# Altium schematic sheet LEDDisplays.SchDoc
size A3; SheetNumber: 3; SheetTotal: 5
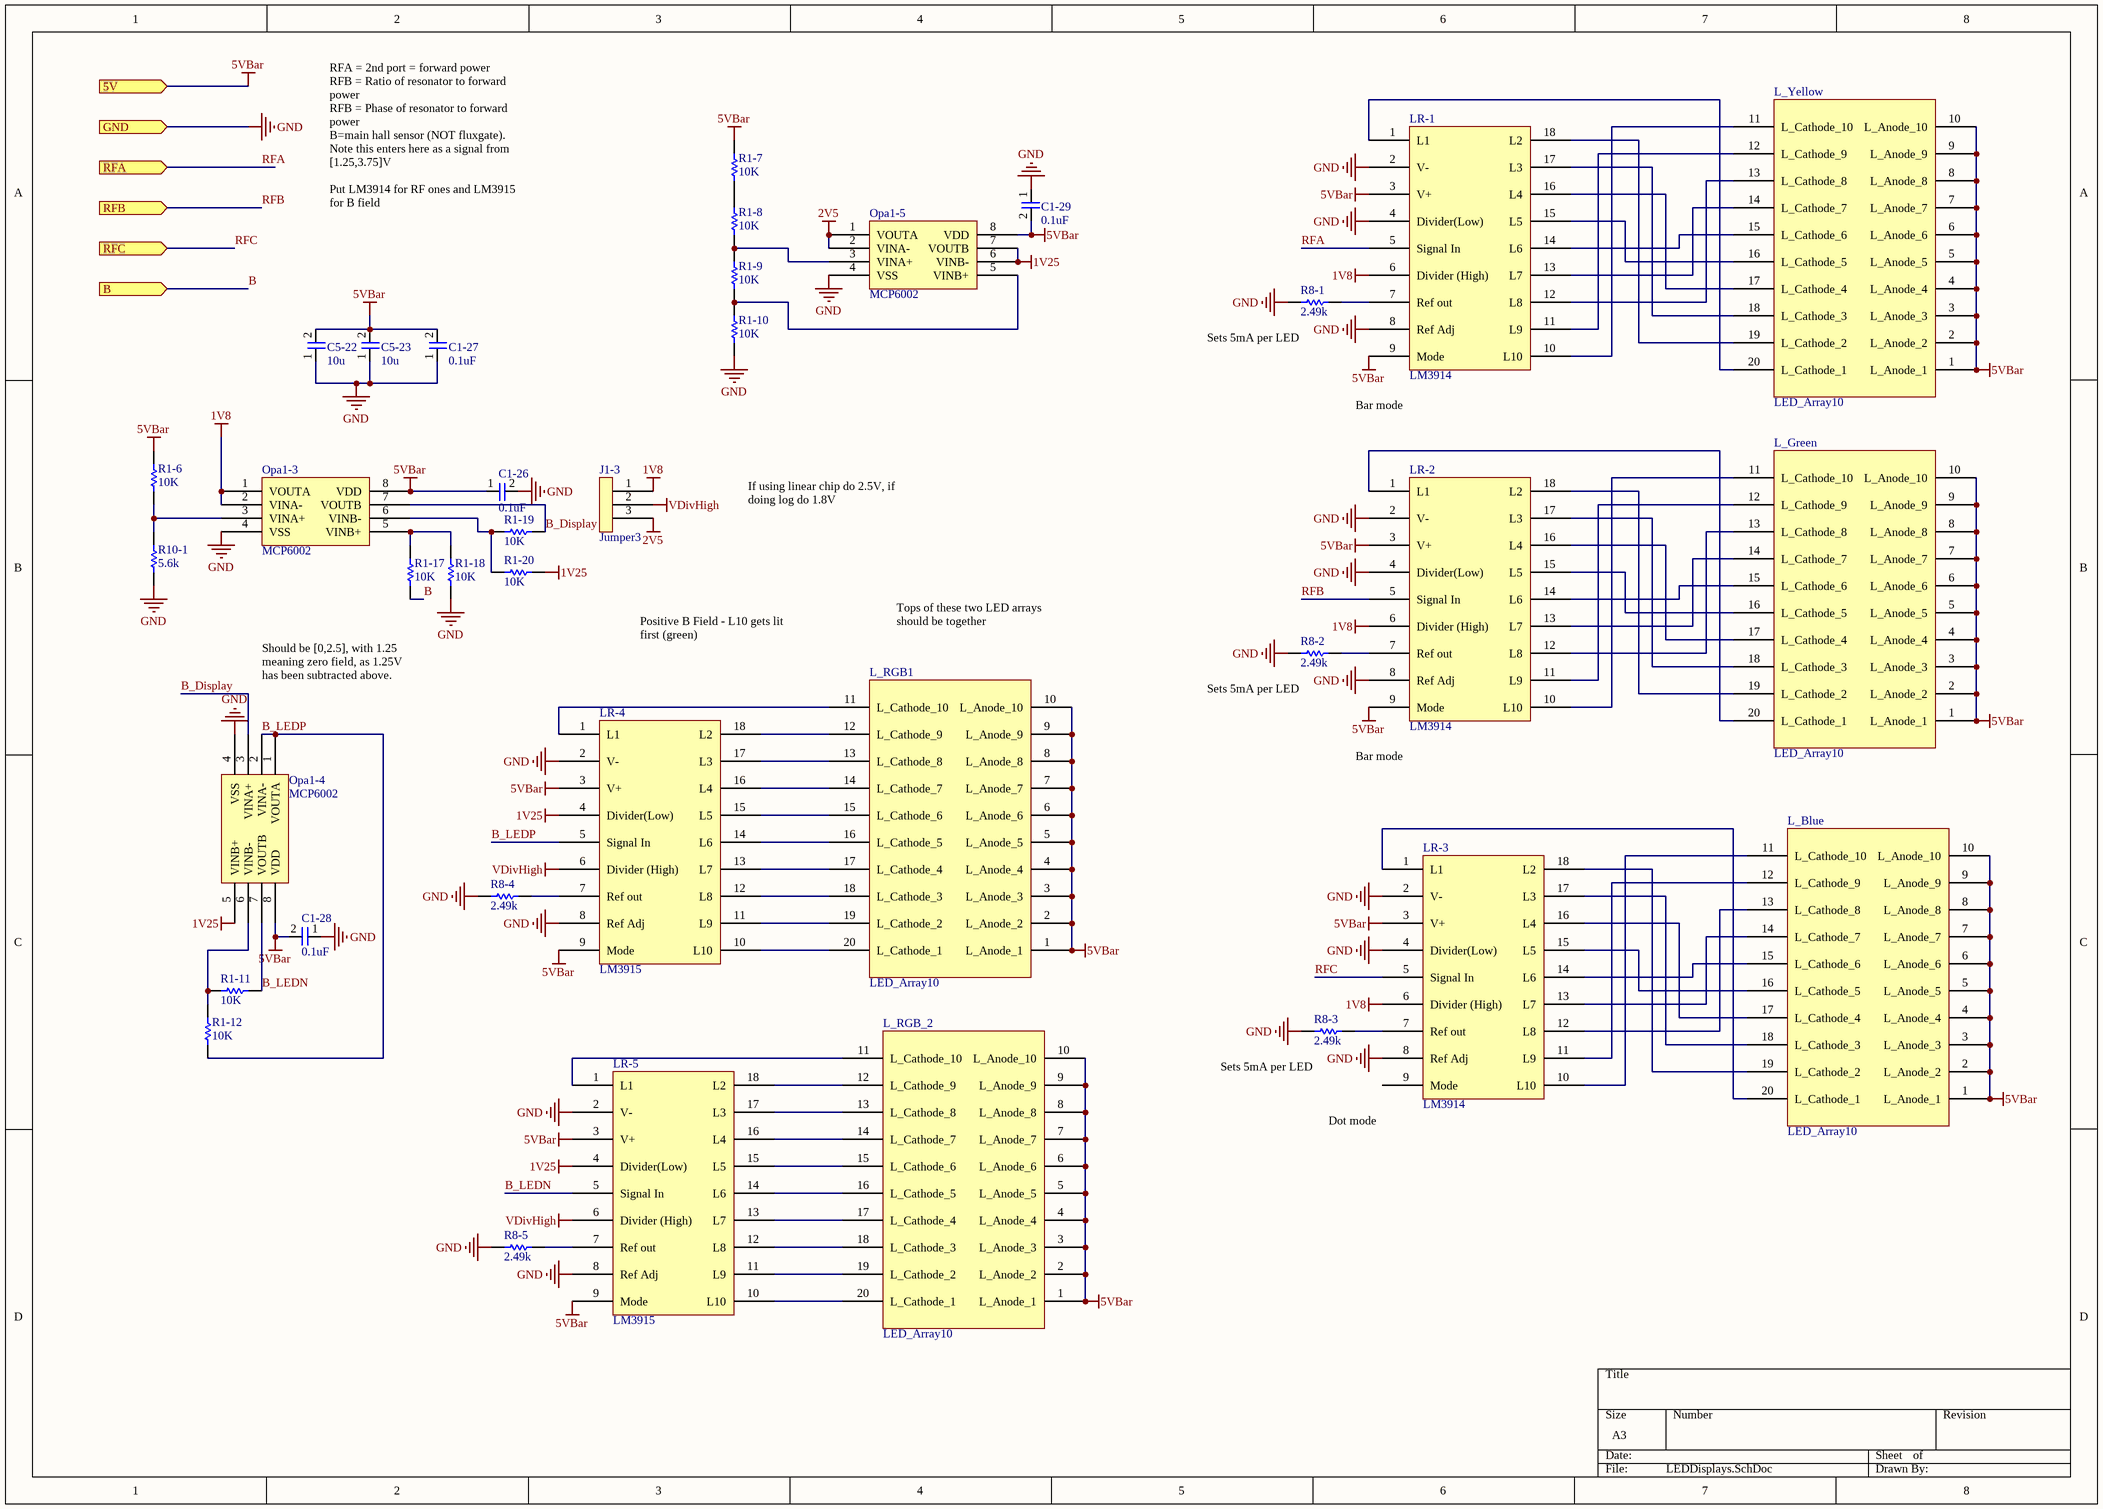
[diagram p0: LEDDisplays.SchDoc]

## Parts
C1-26  0.1uF  [0805]
C1-27  0.1uF  [0805]
C1-28  0.1uF  [0805]
C1-29  0.1uF  [0805]
C5-22  10u  [1206]
C5-23  10u  [1206]
J1-3  Jumper3  [Jumper]
L_Blue  LED_Array10  [10-DIP]
L_Green  LED_Array10  [10-DIP]
L_RGB1  LED_Array10  [10-DIP]
L_RGB_2  LED_Array10  [10-DIP]
L_Yellow  LED_Array10  [10-DIP]
LR-1  LM3914  [18-DIP-Sockeyt]
LR-2  LM3914  [18-DIP-Sockeyt]
LR-3  LM3914  [18-DIP-Sockeyt]
LR-4  LM3915  [18-DIP-Sockeyt]
LR-5  LM3915  [18-DIP-Sockeyt]
Opa1-3  MCP6002  [8-MSOP]
Opa1-4  MCP6002  [8-MSOP]
Opa1-5  MCP6002  [8-MSOP]
R1-6  10K  [0603]
R1-7  10K  [0603]
R1-8  10K  [0603]
R1-9  10K  [0603]
R1-10  10K  [0603]
R1-11  10K  [0603]
R1-12  10K  [0603]
R1-17  10K  [0603]
R1-18  10K  [0603]
R1-19  10K  [0603]
R1-20  10K  [0603]
R8-1  2.49k  [0603]
R8-2  2.49k  [0603]
R8-3  2.49k  [0603]
R8-4  2.49k  [0603]
R8-5  2.49k  [0603]
R10-1  5.6k  [0603]

## Ports
5V (in), B (in), GND (in), RFA (in), RFB (in), RFC (in)

## Nets
1V8: J1-3.1 LR-1.6(Divider_(High)) LR-2.6(Divider_(High)) LR-3.6(Divider_(High)) Opa1-3.1(VOUTA) Opa1-3.2(VINA-)
1V25: LR-4.4(Divider(Low)) LR-5.4(Divider(Low)) Opa1-4.5(VINB+) Opa1-5.6(VINB-) Opa1-5.7(VOUTB) R1-20.2
2V5: J1-3.3 Opa1-5.1(VOUTA) Opa1-5.2(VINA-)
5VBar: C1-26.1 C1-27.2 C1-28.2 C1-29.2 C5-22.2(C1-1) C5-23.2(C1-1) L_Blue.1(L_Anode_1) L_Blue.2(L_Anode_2) L_Blue.3(L_Anode_3) L_Blue.4(L_Anode_4) L_Blue.5(L_Anode_5) L_Blue.6(L_Anode_6) L_Blue.7(L_Anode_7) L_Blue.8(L_Anode_8) L_Blue.9(L_Anode_9) L_Blue.10(L_Anode_10) L_Green.1(L_Anode_1) L_Green.2(L_Anode_2) L_Green.3(L_Anode_3) L_Green.4(L_Anode_4) L_Green.5(L_Anode_5) L_Green.6(L_Anode_6) L_Green.7(L_Anode_7) L_Green.8(L_Anode_8) L_Green.9(L_Anode_9) L_Green.10(L_Anode_10) L_RGB1.1(L_Anode_1) L_RGB1.2(L_Anode_2) L_RGB1.3(L_Anode_3) L_RGB1.4(L_Anode_4) L_RGB1.5(L_Anode_5) L_RGB1.6(L_Anode_6) L_RGB1.7(L_Anode_7) L_RGB1.8(L_Anode_8) L_RGB1.9(L_Anode_9) L_RGB1.10(L_Anode_10) L_RGB_2.1(L_Anode_1) L_RGB_2.2(L_Anode_2) L_RGB_2.3(L_Anode_3) L_RGB_2.4(L_Anode_4) L_RGB_2.5(L_Anode_5) L_RGB_2.6(L_Anode_6) L_RGB_2.7(L_Anode_7) L_RGB_2.8(L_Anode_8) L_RGB_2.9(L_Anode_9) L_RGB_2.10(L_Anode_10) L_Yellow.1(L_Anode_1) L_Yellow.2(L_Anode_2) L_Yellow.3(L_Anode_3) L_Yellow.4(L_Anode_4) L_Yellow.5(L_Anode_5) L_Yellow.6(L_Anode_6) L_Yellow.7(L_Anode_7) L_Yellow.8(L_Anode_8) L_Yellow.9(L_Anode_9) L_Yellow.10(L_Anode_10) LR-1.3(V+) LR-1.9(Mode) LR-2.3(V+) LR-2.9(Mode) LR-3.3(V+) LR-4.3(V+) LR-4.9(Mode) LR-5.3(V+) LR-5.9(Mode) Opa1-3.8(VDD) Opa1-4.8(VDD) Opa1-5.8(VDD) R1-6.1 R1-7.1 ; port 5V
GND: C1-26.2 C1-27.1 C1-28.1 C1-29.1 C5-22.1 C5-23.1 LR-1.2(V-) LR-1.4(Divider(Low)) LR-1.8(Ref_Adj) LR-2.2(V-) LR-2.4(Divider(Low)) LR-2.8(Ref_Adj) LR-3.2(V-) LR-3.4(Divider(Low)) LR-3.8(Ref_Adj) LR-4.2(V-) LR-4.8(Ref_Adj) LR-5.2(V-) LR-5.8(Ref_Adj) Opa1-3.4(VSS) Opa1-4.4(VSS) Opa1-5.4(VSS) R1-10.2 R1-18.2 R8-1.1 R8-2.1 R8-3.1 R8-4.1 R8-5.1 R10-1.2 ; port GND
VDivHigh: J1-3.2 LR-4.6(Divider_(High)) LR-5.6(Divider_(High))
B: R1-17.1 ; port B
B_Display: Opa1-3.7(VOUTB) Opa1-4.3(VINA+) R1-19.2
B_LEDN: LR-5.5(Signal_In) Opa1-4.7(VOUTB) R1-11.2
B_LEDP: LR-4.5(Signal_In) Opa1-4.1(VOUTA) Opa1-4.2(VINA-) R1-12.2
RFA: LR-1.5(Signal_In) ; port RFA
RFB: LR-2.5(Signal_In) ; port RFB
RFC: LR-3.5(Signal_In) ; port RFC
NetL_Blue_11: L_Blue.11(L_Cathode_10) LR-3.10(L10)
NetL_Blue_12: L_Blue.12(L_Cathode_9) LR-3.11(L9)
NetL_Blue_13: L_Blue.13(L_Cathode_8) LR-3.12(L8)
NetL_Blue_14: L_Blue.14(L_Cathode_7) LR-3.13(L7)
NetL_Blue_15: L_Blue.15(L_Cathode_6) LR-3.14(L6)
NetL_Blue_16: L_Blue.16(L_Cathode_5) LR-3.15(L5)
NetL_Blue_17: L_Blue.17(L_Cathode_4) LR-3.16(L4)
NetL_Blue_18: L_Blue.18(L_Cathode_3) LR-3.17(L3)
NetL_Blue_19: L_Blue.19(L_Cathode_2) LR-3.18(L2)
NetL_Blue_20: L_Blue.20(L_Cathode_1) LR-3.1(L1)
NetL_Green_11: L_Green.11(L_Cathode_10) LR-2.10(L10)
NetL_Green_12: L_Green.12(L_Cathode_9) LR-2.11(L9)
NetL_Green_13: L_Green.13(L_Cathode_8) LR-2.12(L8)
NetL_Green_14: L_Green.14(L_Cathode_7) LR-2.13(L7)
NetL_Green_15: L_Green.15(L_Cathode_6) LR-2.14(L6)
NetL_Green_16: L_Green.16(L_Cathode_5) LR-2.15(L5)
NetL_Green_17: L_Green.17(L_Cathode_4) LR-2.16(L4)
NetL_Green_18: L_Green.18(L_Cathode_3) LR-2.17(L3)
NetL_Green_19: L_Green.19(L_Cathode_2) LR-2.18(L2)
NetL_Green_20: L_Green.20(L_Cathode_1) LR-2.1(L1)
NetL_RGB1_11: L_RGB1.11(L_Cathode_10) LR-4.1(L1)
NetL_RGB1_12: L_RGB1.12(L_Cathode_9) LR-4.18(L2)
NetL_RGB1_13: L_RGB1.13(L_Cathode_8) LR-4.17(L3)
NetL_RGB1_14: L_RGB1.14(L_Cathode_7) LR-4.16(L4)
NetL_RGB1_15: L_RGB1.15(L_Cathode_6) LR-4.15(L5)
NetL_RGB1_16: L_RGB1.16(L_Cathode_5) LR-4.14(L6)
NetL_RGB1_17: L_RGB1.17(L_Cathode_4) LR-4.13(L7)
NetL_RGB1_18: L_RGB1.18(L_Cathode_3) LR-4.12(L8)
NetL_RGB1_19: L_RGB1.19(L_Cathode_2) LR-4.11(L9)
NetL_RGB1_20: L_RGB1.20(L_Cathode_1) LR-4.10(L10)
NetL_RGB_2_11: L_RGB_2.11(L_Cathode_10) LR-5.1(L1)
NetL_RGB_2_12: L_RGB_2.12(L_Cathode_9) LR-5.18(L2)
NetL_RGB_2_13: L_RGB_2.13(L_Cathode_8) LR-5.17(L3)
NetL_RGB_2_14: L_RGB_2.14(L_Cathode_7) LR-5.16(L4)
NetL_RGB_2_15: L_RGB_2.15(L_Cathode_6) LR-5.15(L5)
NetL_RGB_2_16: L_RGB_2.16(L_Cathode_5) LR-5.14(L6)
NetL_RGB_2_17: L_RGB_2.17(L_Cathode_4) LR-5.13(L7)
NetL_RGB_2_18: L_RGB_2.18(L_Cathode_3) LR-5.12(L8)
NetL_RGB_2_19: L_RGB_2.19(L_Cathode_2) LR-5.11(L9)
NetL_RGB_2_20: L_RGB_2.20(L_Cathode_1) LR-5.10(L10)
NetL_Yellow_11: L_Yellow.11(L_Cathode_10) LR-1.10(L10)
NetL_Yellow_12: L_Yellow.12(L_Cathode_9) LR-1.11(L9)
NetL_Yellow_13: L_Yellow.13(L_Cathode_8) LR-1.12(L8)
NetL_Yellow_14: L_Yellow.14(L_Cathode_7) LR-1.13(L7)
NetL_Yellow_15: L_Yellow.15(L_Cathode_6) LR-1.14(L6)
NetL_Yellow_16: L_Yellow.16(L_Cathode_5) LR-1.15(L5)
NetL_Yellow_17: L_Yellow.17(L_Cathode_4) LR-1.16(L4)
NetL_Yellow_18: L_Yellow.18(L_Cathode_3) LR-1.17(L3)
NetL_Yellow_19: L_Yellow.19(L_Cathode_2) LR-1.18(L2)
NetL_Yellow_20: L_Yellow.20(L_Cathode_1) LR-1.1(L1)
NetLR-1_7: LR-1.7(Ref_out) R8-1.2
NetLR-2_7: LR-2.7(Ref_out) R8-2.2
NetLR-3_7: LR-3.7(Ref_out) R8-3.2
NetLR-4_7: LR-4.7(Ref_out) R8-4.2
NetLR-5_7: LR-5.7(Ref_out) R8-5.2
NetOpa1-3_3: Opa1-3.3(VINA+) R1-6.2 R10-1.1
NetOpa1-3_5: Opa1-3.5(VINB+) R1-17.2 R1-18.1
NetOpa1-3_6: Opa1-3.6(VINB-) R1-19.1 R1-20.1
NetOpa1-4_6: Opa1-4.6(VINB-) R1-11.1 R1-12.1
NetOpa1-5_3: Opa1-5.3(VINA+) R1-8.2 R1-9.1
NetOpa1-5_5: Opa1-5.5(VINB+) R1-9.2 R1-10.1
NetR1-7_2: R1-7.2 R1-8.1

Not connected (* = marked no-connect by the designer): LR-3 9(Mode)

## Notes on the sheet
- RFA = 2nd port = forward power
  RFB = Ratio of resonator to forward power
  RFB = Phase of resonator to forward power
  B=main hall sensor (NOT fluxgate). Note this enters here as a signal from [1.25,3.75]V
  Put LM3914 for RF ones and LM3915 for B field
- (near R8-1) Sets 5mA per LED
- (near LR-1) Bar mode
- If using linear chip do 2.5V, if doing log do 1.8V
- Tops of these two LED arrays should be together
- Should be [0,2.5], with 1.25 meaning zero field, as 1.25V has been subtracted above.
- Positive B Field - L10 gets lit first (green)
- (near R8-2) Sets 5mA per LED
- (near LR-2) Bar mode
- (near R8-3) Sets 5mA per LED
- (near LR-3) Dot mode

## Library data of the parts
C1-26-C1-29 = Capacitor1
C5-22 C5-23 = Capacitor1205: Digikey P/N: 1276-6767-1-ND
LR-4 LR-5 = LM3914: Digikey P/N: 1175-1489-ND
R1-6-R1-12 R1-17-R1-20 R8-1-R8-5 R10-1 = Res1: Resistor; FP: 0603 (1608 Metric)
  R1-6-R1-12 R1-17-R1-20: Digikey P/N: 311-10.0KHRCT-ND
  R8-1-R8-5: Digikey P/N: P2.49KDBCT-ND
  R10-1: Digikey P/N: RG16P5.6KBCT-ND
J1-3 = Jumper3: Digikey P/M: 609-3461-ND, S9000-ND
L_Blue L_Green L_RGB1 L_RGB_2 L_Yellow = LED_Array10
  L_Blue L_RGB1 L_RGB_2: Digikey P/N: 1497-1079-5-ND
  L_Green: Digikey P/N: 1497-1082-5-ND
  L_Yellow: Digikey P/N: 1497-XGMYKX10D-ND
LR-1-LR-3 = LM3914: Digikey P/N: 1175-1489-ND
Opa1-3-Opa1-5 = MCP6002: Digikey P/N: MCP6002T-I/MSCT-ND